# Altium schematic sheet Inrush Current Limiter.SchDoc
size A; SheetNumber: 6; SheetTotal: 6
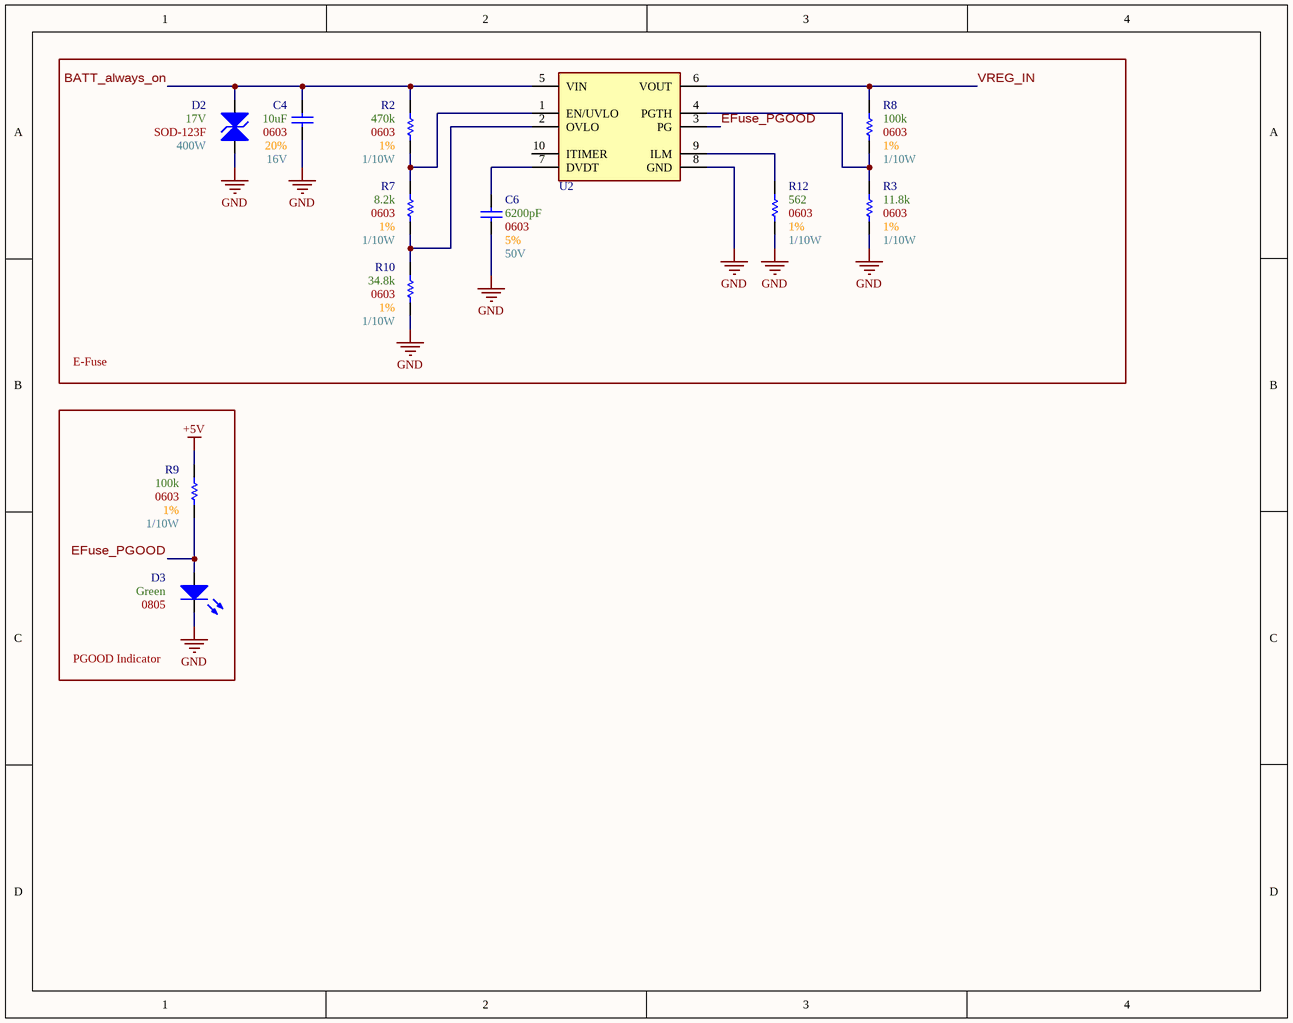
[diagram p0: Inrush Current Limiter.SchDoc]

## Parts
C4  Max Voltage: 16V  Size Package: 0603  Tolerance: 20%  Capacitance: 10uF  [[Cap] SMD 0603]  (hidden comment: [Cap] 0603 10uF 20% 16V)
C6  Max Voltage: 50V  Size Package: 0603  Tolerance: 5%  Capacitance: 6200pF  [[Cap] SMD 0603]  (hidden comment: [Cap] 0603 6200pF 5% 50V)
D2  Wattage: 400W  Optimal Zener Voltage: 17V  Footprint: SOD-123F  [[Diode] SOD-123F]  (hidden comment: SZSMF4L17CAT3G)
D3  Color: Green  Size Package: 0805  [[LED] SMD 0805]  (hidden comment: [LED] SMD 0805 Green)
R2  Wattage: 1/10W  Tolerance: 1%  Resistance: 470k  Size Package: 0603  [[Res] SMD 0603]  (hidden comment: [470k] SMD 0603 1% 1/10W)
R3  Wattage: 1/10W  Tolerance: 1%  Resistance: 11.8k  Size Package: 0603  [[Res] SMD 0603]  (hidden comment: [11.8k] SMD 0603 1% 1/10W)
R7  Wattage: 1/10W  Tolerance: 1%  Resistance: 8.2k  Size Package: 0603  [[Res] SMD 0603]  (hidden comment: [8.2k] SMD 0603 1% 1/10W)
R8  Wattage: 1/10W  Tolerance: 1%  Resistance: 100k  Size Package: 0603  [[Res] SMD 0603]  (hidden comment: [100k] SMD 0603 1% 1/10W)
R9  Wattage: 1/10W  Tolerance: 1%  Resistance: 100k  Size Package: 0603  [[Res] SMD 0603]  (hidden comment: [100k] SMD 0603 1% 1/10W)
R10  Wattage: 1/10W  Tolerance: 1%  Resistance: 34.8k  Size Package: 0603  [[Res] SMD 0603]  (hidden comment: [34.8k] SMD 0603 1% 1/10W)
R12  Wattage: 1/10W  Tolerance: 1%  Resistance: 562  Size Package: 0603  [[Res] SMD 0603]  (hidden comment: [562] SMD 0603 1% 1/10W)
U2  TPS259460ARPWR  [10-VQFN-HR (2x2)]  (value not drawn)

## Blocks framed on the sheet
E-Fuse: C4 C6 D2 R2 R3 R7 R8 R10 R12 U2
PGOOD Indicator: D3 R9

## Nets
+5V: R9.2
GND: C4.1 C6.1 D2.2(A) D3.2(Cathode) R3.1 R10.1 R12.1 U2.8(GND)
BATT_always_on: C4.2 D2.1(K) R2.2 U2.5(VIN)
EFuse_PGOOD: D3.1(Anode) R9.1 U2.3(PG)
VREG_IN: R8.2 U2.6(VOUT)
NetC6_2: C6.2 U2.7(DVDT)
NetR2_1: R2.1 R7.2 U2.1(EN/UVLO)
NetR3_2: R3.2 R8.1 U2.4(PGTH)
NetR7_1: R7.1 R10.2 U2.2(OVLO)
NetR12_2: R12.2 U2.9(ILM)

Not connected (* = marked no-connect by the designer): U2 10(ITIMER)

## Library data of the parts
C4 = [Cap] 0603 10uF 20% 16V: GRM188C81C106MA73D; Supplier 1: DigiKey; Supplier Part Number 1: 490-7198-1-ND
C6 = [Cap] 0603 6200pF 5% 50V: C0603C622J5GACTU; Supplier 1: DigiKey; Supplier Part Number 1: 399-9977-6-ND
D2 = [TVS] 17Vnom 27.6Vclamp_max: Supplier 1: DigiKey; Supplier Part Number 1: 18-SZSMF4L17CAT3GCT-ND
D3 = [LED] SMD 0805 Green: LG R971-KN-1-0-20-R18; Supplier 1: DigiKey; Supplier Part Number 1: 475-LGR971-KN-1CT-ND
R2 = [470k] SMD 0603 1% 1/10W: CRGCQ0603F470K; Supplier 1: DigiKey; Supplier Part Number 1: A129720DKR-ND
R3 = [11.8k] SMD 0603 1% 1/10W: RK73H1JTTD1182F; Supplier 1: DigiKey; Supplier Part Number 1: 2019-RK73H1JTTD1182FDKR-ND
R7 = [8.2k] SMD 0603 1% 1/10W: MCT06030C8201FP500; Supplier 1: DigiKey; Supplier Part Number 1: MCT0603-8.20K-CFDKR-ND
R8 R9 = [100k] SMD 0603 1% 1/10W: RC0603FR-07100KL; Supplier 1: DigiKey; Supplier Part Number 1: 311-100KHRDKR-ND
R10 = [34.8k] SMD 0603 1% 1/10W: RMCF0603FT34K8; Supplier 1: DigiKey; Supplier Part Number 1: RMCF0603FT34K8DKR-ND
R12 = [562] SMD 0603 1% 1/10W: ERJ-3EKF5620V; Supplier 1: DigiKey; Supplier Part Number 1: P562HDKR-ND
U2 = [E-Fuse] 2.7-23V 5.5A: Supplier 1: DigiKey; Supplier Part Number 1: 296-TPS259460ARPWRDKR-ND